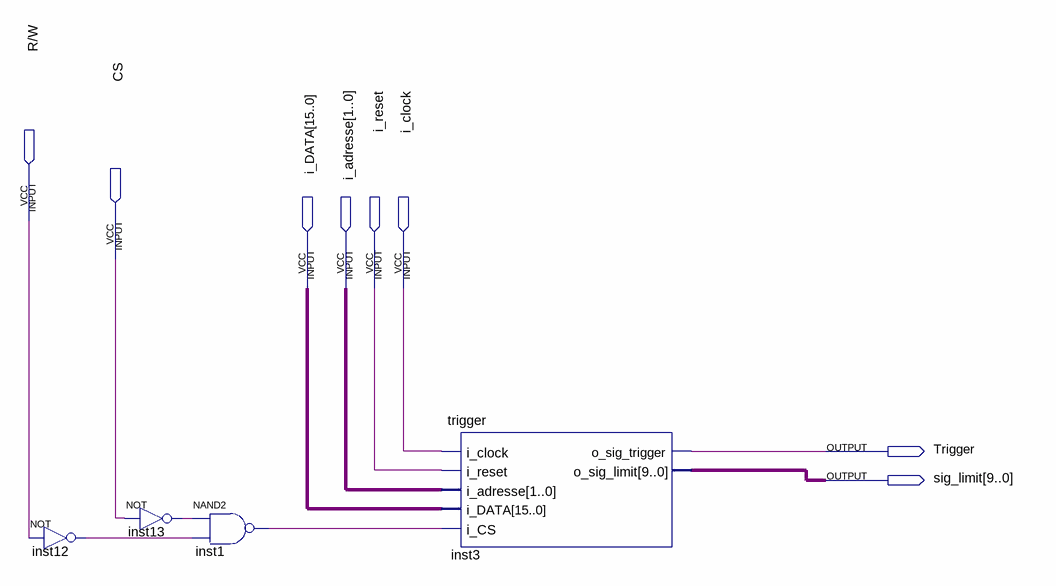
[diagram p0: schematic sheet]
// Quartus schematic trigger_2.bdf as structural Verilog: 4 symbols, 8 pins
module trigger_2 (
  input  \R/W ,
  input  CS,
  input  [15:0] i_DATA,
  input  [1:0] i_adresse,
  input  i_reset,
  input  i_clock,
  output Trigger,
  output [9:0] sig_limit
);

  wire inst1_out, inst12_out, inst13_out;

  not inst12 (inst12_out, \R/W );
  not inst13 (inst13_out, CS);
  nand inst1 (inst1_out, inst13_out, inst12_out);
  trigger inst3 (
    .i_clock(i_clock), .i_reset(i_reset), .i_adresse(i_adresse), .i_DATA(i_DATA), .i_CS(inst1_out),
    .o_sig_trigger(Trigger), .o_sig_limit(sig_limit));
endmodule
